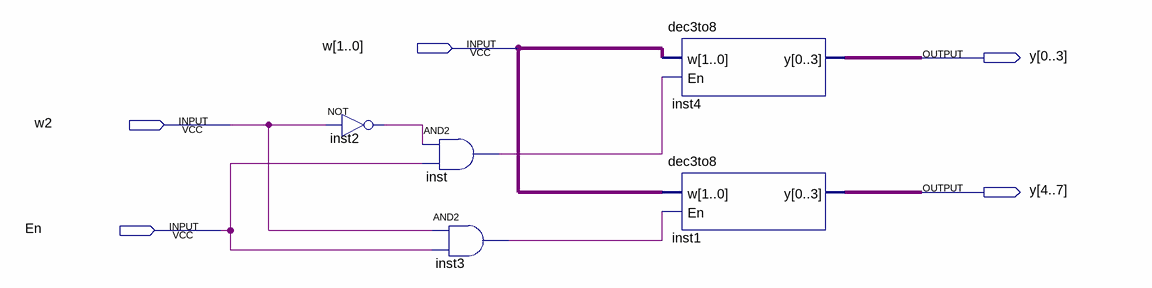
[diagram p0: schematic sheet]
// Quartus schematic 3to8decoder.bdf as structural Verilog: 5 symbols, 5 pins
module \3to8decoder  (
  input  [1:0] w,
  input  w2,
  input  En,
  output [0:7] y
);

  wire inst2_out, inst3_out, inst_out;

  not inst2 (inst2_out, w2);
  and inst (inst_out, inst2_out, En);
  and inst3 (inst3_out, w2, En);
  dec3to8 inst4 (.w(w), .En(inst_out), .y(y[0:3]));
  dec3to8 inst1 (.w(w), .En(inst3_out), .y(y[4:7]));
endmodule
